# Altium schematic sheet PowerLegs.SchDoc: Title
size 594 x 420 mm; CompanyName: Лаборатория беспилотных систем; Address1: Address1; Address2: Address2; Address3: Address3; Address4: Address4; DocumentNumber: АБВГ.123456.001 Э3; SheetNumber: 2; SheetTotal: 2; Scale: -; DocumentType: Схема электрическая принципиальная; FirstReferrence: АБВГ.123456.001
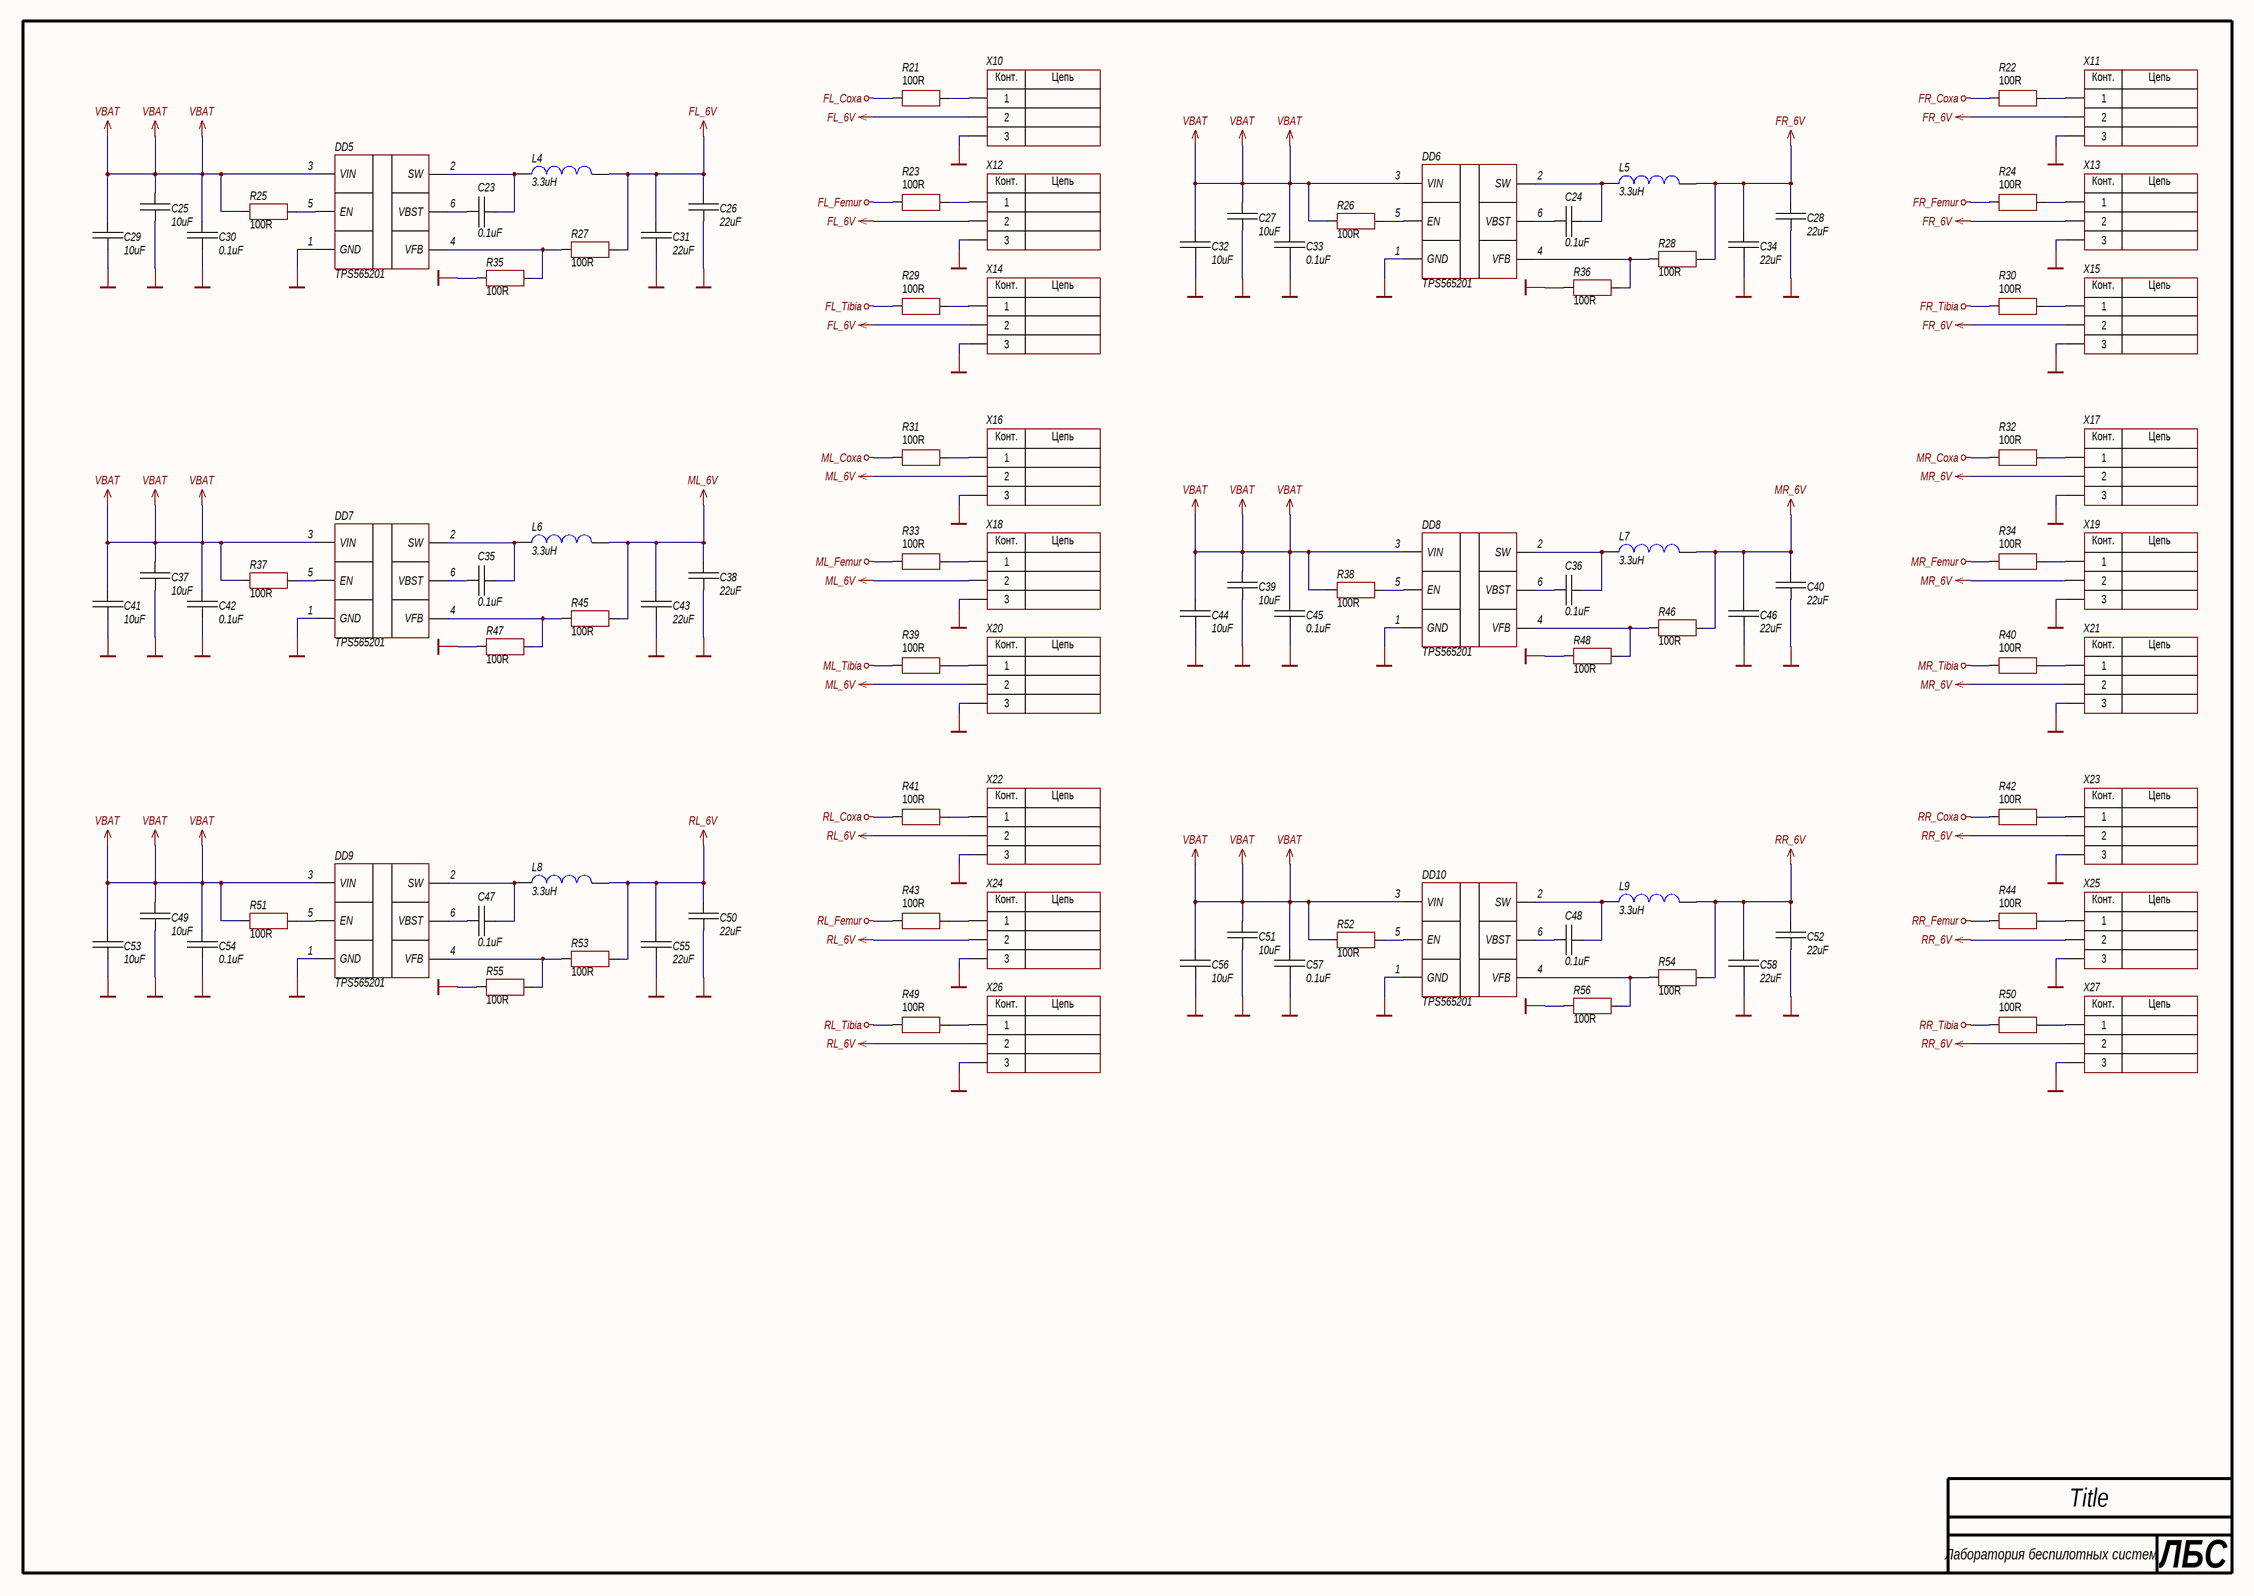
[diagram p0: PowerLegs.SchDoc]

## Parts
C23  value 0.1uF  [CAP: 0603]  (hidden comment: Ceramic capacitor, 0.01uF, X7R, ±10%, 16V, 0603, -55...+125°C)
C24  value 0.1uF  [CAP: 0603]  (hidden comment: Ceramic capacitor, 0.01uF, X7R, ±10%, 16V, 0603, -55...+125°C)
C25  value 10uF  [CAP: 1206]
C26  value 22uF  [CAP: 1206]  (hidden comment: Ceramic capacitor, 10uF, X7R, ±10%, 50V, 1206, -55...+125°C)
C27  value 10uF  [CAP: 1206]  (hidden comment: Ceramic capacitor, 0.1uF, X7R, ±10%, 16V, 0603, -55...+125°C)
C28  value 22uF  [CAP: 1206]  (hidden comment: Ceramic capacitor, 10uF, X7R, ±10%, 50V, 1206, -55...+125°C)
C29  value 10uF  [CAP: 1206]
C30  value 0.1uF  [CAP: 0603]
C31  value 22uF  [CAP: 1206]  (hidden comment: Polymer Cap, 330uF, 35V, ±20%, 40mOhm@100kHz, SMD,7.3x4.3х1.9mm, -55...+125°C)
C32  value 10uF  [CAP: 1206]  (hidden comment: Polymer Cap, 330uF, 35V, ±20%, 40mOhm@100kHz, SMD,7.3x4.3х1.9mm, -55...+125°C)
C33  value 0.1uF  [CAP: 0603]
C34  value 22uF  [CAP: 1206]  (hidden comment: Ceramic capacitor, 0.1uF, X7R, ±10%, 16V, 0603, -55...+125°C)
C35  value 0.1uF  [CAP: 0603]
C36  value 0.1uF  [CAP: 0603]
C37  value 10uF  [CAP: 1206]  (hidden comment: Ceramic capacitor, 0.01uF, X7R, ±10%, 16V, 0603, -55...+125°C)
C38  value 22uF  [CAP: 1206]  (hidden comment: Ceramic capacitor, 0.01uF, X7R, ±10%, 16V, 0603, -55...+125°C)
C39  value 10uF  [CAP: 1206]
C40  value 22uF  [CAP: 1206]  (hidden comment: Ceramic capacitor, 10uF, X7R, ±10%, 50V, 1206, -55...+125°C)
C41  value 10uF  [CAP: 1206]  (hidden comment: Ceramic capacitor, 0.1uF, X7R, ±10%, 16V, 0603, -55...+125°C)
C42  value 0.1uF  [CAP: 0603]  (hidden comment: Ceramic capacitor, 10uF, X7R, ±10%, 50V, 1206, -55...+125°C)
C43  value 22uF  [CAP: 1206]  (hidden comment: Ceramic capacitor, 10uF, X7R, ±10%, 50V, 1206, -55...+125°C)
C44  value 10uF  [CAP: 1206]  (hidden comment: Ceramic capacitor, 0.1uF, X7R, ±10%, 16V, 0603, -55...+125°C)
C45  value 0.1uF  [CAP: 0603]  (hidden comment: Polymer Cap, 330uF, 35V, ±20%, 40mOhm@100kHz, SMD,7.3x4.3х1.9mm, -55...+125°C)
C46  value 22uF  [CAP: 1206]  (hidden comment: Polymer Cap, 330uF, 35V, ±20%, 40mOhm@100kHz, SMD,7.3x4.3х1.9mm, -55...+125°C)
C47  value 0.1uF  [CAP: 0603]
C48  value 0.1uF  [CAP: 0603]
C49  value 10uF  [CAP: 1206]
C50  value 22uF  [CAP: 1206]
C51  value 10uF  [CAP: 1206]  (hidden comment: Ceramic capacitor, 0.01uF, X7R, ±10%, 16V, 0603, -55...+125°C)
C52  value 22uF  [CAP: 1206]  (hidden comment: Ceramic capacitor, 0.01uF, X7R, ±10%, 16V, 0603, -55...+125°C)
C53  value 10uF  [CAP: 1206]
C54  value 0.1uF  [CAP: 0603]  (hidden comment: Ceramic capacitor, 10uF, X7R, ±10%, 50V, 1206, -55...+125°C)
C55  value 22uF  [CAP: 1206]  (hidden comment: Ceramic capacitor, 0.1uF, X7R, ±10%, 16V, 0603, -55...+125°C)
C56  value 10uF  [CAP: 1206]
C57  value 0.1uF  [CAP: 0603]  (hidden comment: Ceramic capacitor, 10uF, X7R, ±10%, 50V, 1206, -55...+125°C)
C58  value 22uF  [CAP: 1206]  (hidden comment: Ceramic capacitor, 0.1uF, X7R, ±10%, 16V, 0603, -55...+125°C)
DD5  TPS565201  [SOT23-6]
DD6  TPS565201  [SOT23-6]
DD7  TPS565201  [SOT23-6]
DD8  TPS565201  [SOT23-6]
DD9  TPS565201  [SOT23-6]
DD10  TPS565201  [SOT23-6]
L4  value 3.3uH  [IND: SMD_L2.5-W2.0]  (hidden comment: Fixed inductor, 15uH, ±20%, SMD,2x2.5mm, 1.1A,)
L5  value 3.3uH  [IND: SMD_L2.5-W2.0]  (hidden comment: Fixed inductor, 15uH, ±20%, SMD,2x2.5mm, 1.1A,)
L6  value 3.3uH  [IND: SMD_L2.5-W2.0]  (hidden comment: Fixed inductor, 15uH, ±20%, SMD,2x2.5mm, 1.1A,)
L7  value 3.3uH  [IND: SMD_L2.5-W2.0]  (hidden comment: Fixed inductor, 15uH, ±20%, SMD,2x2.5mm, 1.1A,)
L8  value 3.3uH  [IND: SMD_L2.5-W2.0]  (hidden comment: Fixed inductor, 15uH, ±20%, SMD,2x2.5mm, 1.1A,)
L9  value 3.3uH  [IND: SMD_L2.5-W2.0]  (hidden comment: Fixed inductor, 15uH, ±20%, SMD,2x2.5mm, 1.1A,)
R21  value 100R  [RES: 0603]
R22  value 100R  [RES: 0603]
R23  value 100R  [RES: 0603]
R24  value 100R  [RES: 0603]
R25  value 100R  [RES: 0603]
R26  value 100R  [RES: 0603]
R27  value 100R  [RES: 0603]
R28  value 100R  [RES: 0603]
R29  value 100R  [RES: 0603]
R30  value 100R  [RES: 0603]
R31  value 100R  [RES: 0603]
R32  value 100R  [RES: 0603]
R33  value 100R  [RES: 0603]
R34  value 100R  [RES: 0603]
R35  value 100R  [RES: 0603]
R36  value 100R  [RES: 0603]
R37  value 100R  [RES: 0603]
R38  value 100R  [RES: 0603]
R39  value 100R  [RES: 0603]
R40  value 100R  [RES: 0603]
R41  value 100R  [RES: 0603]
R42  value 100R  [RES: 0603]
R43  value 100R  [RES: 0603]
R44  value 100R  [RES: 0603]
R45  value 100R  [RES: 0603]
R46  value 100R  [RES: 0603]
R47  value 100R  [RES: 0603]
R48  value 100R  [RES: 0603]
R49  value 100R  [RES: 0603]
R50  value 100R  [RES: 0603]
R51  value 100R  [RES: 0603]
R52  value 100R  [RES: 0603]
R53  value 100R  [RES: 0603]
R54  value 100R  [RES: 0603]
R55  value 100R  [RES: 0603]
R56  value 100R  [RES: 0603]
X10  (no value)  [CON: PLS-3]
X11  (no value)  [CON: PLS-3]
X12  (no value)  [CON: PLS-3]
X13  (no value)  [CON: PLS-3]
X14  (no value)  [CON: PLS-3]
X15  (no value)  [CON: PLS-3]
X16  (no value)  [CON: PLS-3]
X17  (no value)  [CON: PLS-3]
X18  (no value)  [CON: PLS-3]
X19  (no value)  [CON: PLS-3]
X20  (no value)  [CON: PLS-3]
X21  (no value)  [CON: PLS-3]
X22  (no value)  [CON: PLS-3]
X23  (no value)  [CON: PLS-3]
X24  (no value)  [CON: PLS-3]
X25  (no value)  [CON: PLS-3]
X26  (no value)  [CON: PLS-3]
X27  (no value)  [CON: PLS-3]

## Nets
FL_6V: C26.2 C31.1 L4.1 R27.1 X10.2 X12.2 X14.2
FL_Coxa: R21.1
FL_Femur: R23.1
FL_Tibia: R29.1
FR_6V: C28.2 C34.1 L5.1 R28.1 X11.2 X13.2 X15.2
FR_Coxa: R22.1
FR_Femur: R24.1
FR_Tibia: R30.1
GND: C25.1 C26.1 C27.1 C28.1 C29.1 C30.1 C31.2 C32.2 C33.2 C34.2 C37.1 C38.1 C39.1 C40.1 C41.1 C42.1 C43.1 C44.1 C45.2 C46.2 C49.1 C50.1 C51.1 C52.1 C53.1 C54.1 C55.1 C56.1 C57.1 C58.1 DD5.1(GND) DD6.1(GND) DD7.1(GND) DD8.1(GND) DD9.1(GND) DD10.1(GND) R35.2 R36.2 R47.2 R48.2 R55.2 R56.2 X10.3 X11.3 X12.3 X13.3 X14.3 X15.3 X16.3 X17.3 X18.3 X19.3 X20.3 X21.3 X22.3 X23.3 X24.3 X25.3 X26.3 X27.3
ML_6V: C38.2 C43.2 L6.1 R45.1 X16.2 X18.2 X20.2
ML_Coxa: R31.1
ML_Femur: R33.1
ML_Tibia: R39.1
MR_6V: C40.2 C46.1 L7.1 R46.1 X17.2 X19.2 X21.2
MR_Coxa: R32.1
MR_Femur: R34.1
MR_Tibia: R40.1
RL_6V: C50.2 C55.2 L8.1 R53.1 X22.2 X24.2 X26.2
RL_Coxa: R41.1
RL_Femur: R43.1
RL_Tibia: R49.1
RR_6V: C52.2 C58.2 L9.1 R54.1 X23.2 X25.2 X27.2
RR_Coxa: R42.1
RR_Femur: R44.1
RR_Tibia: R50.1
VBAT: C25.2 C27.2 C29.2 C30.2 C32.2 C33.2 C37.2 C39.2 C41.2 C42.2 C44.2 C45.2 C49.2 C51.2 C53.2 C54.2 C56.2 C57.2 DD5.3(VIN) DD6.3(VIN) DD7.3(VIN) DD8.3(VIN) DD9.3(VIN) DD10.3(VIN) R25.2 R26.2 R37.2 R38.2 R51.2 R52.2
NetC23_1: C23.1 DD5.2(SW) L4.2
NetC23_2: C23.2 DD5.6(VBST)
NetC24_1: C24.1 DD6.2(SW) L5.2
NetC24_2: C24.2 DD6.6(VBST)
NetC35_1: C35.1 DD7.2(SW) L6.2
NetC35_2: C35.2 DD7.6(VBST)
NetC36_1: C36.1 DD8.2(SW) L7.2
NetC36_2: C36.2 DD8.6(VBST)
NetC47_1: C47.1 DD9.2(SW) L8.2
NetC47_2: C47.2 DD9.6(VBST)
NetC48_1: C48.1 DD10.2(SW) L9.2
NetC48_2: C48.2 DD10.6(VBST)
NetDD5_4: DD5.4(VFB) R27.2 R35.1
NetDD5_5: DD5.5(EN) R25.1
NetDD6_4: DD6.4(VFB) R28.2 R36.1
NetDD6_5: DD6.5(EN) R26.1
NetDD7_4: DD7.4(VFB) R45.2 R47.1
NetDD7_5: DD7.5(EN) R37.1
NetDD8_4: DD8.4(VFB) R46.2 R48.1
NetDD8_5: DD8.5(EN) R38.1
NetDD9_4: DD9.4(VFB) R53.2 R55.1
NetDD9_5: DD9.5(EN) R51.1
NetDD10_4: DD10.4(VFB) R54.2 R56.1
NetDD10_5: DD10.5(EN) R52.1
NetR21_2: R21.2 X10.1
NetR22_2: R22.2 X11.1
NetR23_2: R23.2 X12.1
NetR24_2: R24.2 X13.1
NetR29_2: R29.2 X14.1
NetR30_2: R30.2 X15.1
NetR31_2: R31.2 X16.1
NetR32_2: R32.2 X17.1
NetR33_2: R33.2 X18.1
NetR34_2: R34.2 X19.1
NetR39_2: R39.2 X20.1
NetR40_2: R40.2 X21.1
NetR41_2: R41.2 X22.1
NetR42_2: R42.2 X23.1
NetR43_2: R43.2 X24.1
NetR44_2: R44.2 X25.1
NetR49_2: R49.2 X26.1
NetR50_2: R50.2 X27.1

## Notes on the sheet
- ЛБС
- (in symbol PLS-3) Конт.; Цепь

## Library data of the parts
C23 C24 = Ceramic_0603: Manufacturer: Yageo; PartNumber: CC0603KRX7R7BB104; ValueManufacturerPartNumber: Ceramic capacitor, 0.1uF, X7R, ±10%, 16V, 0603, -55...+125°C; Package: 0603; HelpURL: https://www.digikey.com/product-detail/en/yageo/CC0603KRX7R7BB104/311-1088-1-ND/302998; Temperature: -55...+125°C; TypeCapacitor: Ceramic capacitor; Tolerance: ±10%; TypeDielectric: X7R; Voltage: 16V
C25 C29 C32 C39 C49 C53 C56 = Ceramic_1206: Manufacturer: Yageo; PartNumber: CC1206KRX7R9BB104; ValueManufacturerPartNumber: Ceramic capacitor, 10uF, X7R, ±10%, 50V, 1206, -55...+125°C; TypeCapacitor: Ceramic capacitor; Tolerance: ±10%; TypeDielectric: X7R; Voltage: 50V; Package: 1206; HelpURL: https://www.digikey.com/product-detail/en/yageo/CC1206KRX7R9BB104/311-1179-1-ND/303089; Temperature: -55...+125°C
C26 C28 C40 C43 = Ceramic_1206: Manufacturer: Yageo; PartNumber: CC1206KRX7R9BB104; ValueManufacturerPartNumber: Ceramic capacitor, 22uF, X7R, ±10%, 50V, 1206, -55...+125°C; Package: 1206; HelpURL: https://www.digikey.com/product-detail/en/yageo/CC1206KRX7R9BB104/311-1179-1-ND/303089; Temperature: -55...+125°C; TypeCapacitor: Ceramic capacitor; Tolerance: ±10%; TypeDielectric: X7R; Voltage: 50V
C27 C37 C41 C44 C51 = Ceramic_1206: Manufacturer: Yageo; PartNumber: CC1206KRX7R9BB104; ValueManufacturerPartNumber: Ceramic capacitor, 10uF, X7R, ±10%, 50V, 1206, -55...+125°C; Voltage: 50V; Package: 1206; HelpURL: https://www.digikey.com/product-detail/en/yageo/CC1206KRX7R9BB104/311-1179-1-ND/303089; Temperature: -55...+125°C; TypeCapacitor: Ceramic capacitor; Tolerance: ±10%; TypeDielectric: X7R
C30 C33 C35 C36 C45 C47 C48 = Ceramic_0603: Manufacturer: Yageo; PartNumber: CC0603KRX7R7BB104; ValueManufacturerPartNumber: Ceramic capacitor, 0.1uF, X7R, ±10%, 16V, 0603, -55...+125°C; TypeCapacitor: Ceramic capacitor; Tolerance: ±10%; TypeDielectric: X7R; Voltage: 16V; Package: 0603; HelpURL: https://www.digikey.com/product-detail/en/yageo/CC0603KRX7R7BB104/311-1088-1-ND/302998; Temperature: -55...+125°C
C31 C46 C50 = Ceramic_1206: Manufacturer: Yageo; PartNumber: CC1206KRX7R9BB104; ValueManufacturerPartNumber: Ceramic capacitor, 22uF, X7R, ±10%, 50V, 1206, -55...+125°C; TypeCapacitor: Ceramic capacitor; Tolerance: ±10%; TypeDielectric: X7R; Voltage: 50V; Package: 1206; HelpURL: https://www.digikey.com/product-detail/en/yageo/CC1206KRX7R9BB104/311-1179-1-ND/303089; Temperature: -55...+125°C
C34 C38 C52 C55 C58 = Ceramic_1206: Manufacturer: Yageo; PartNumber: CC1206KRX7R9BB104; ValueManufacturerPartNumber: Ceramic capacitor, 22uF, X7R, ±10%, 50V, 1206, -55...+125°C; Voltage: 50V; Package: 1206; HelpURL: https://www.digikey.com/product-detail/en/yageo/CC1206KRX7R9BB104/311-1179-1-ND/303089; Temperature: -55...+125°C; TypeCapacitor: Ceramic capacitor; Tolerance: ±10%; TypeDielectric: X7R
C42 C54 C57 = Ceramic_0603: Manufacturer: Yageo; PartNumber: CC0603KRX7R7BB104; ValueManufacturerPartNumber: Ceramic capacitor, 0.1uF, X7R, ±10%, 16V, 0603, -55...+125°C; Voltage: 16V; Package: 0603; HelpURL: https://www.digikey.com/product-detail/en/yageo/CC0603KRX7R7BB104/311-1088-1-ND/302998; Temperature: -55...+125°C; TypeCapacitor: Ceramic capacitor; Tolerance: ±10%; TypeDielectric: X7R
L4-L9 = Inductor_FTC252010S220MBCA: Manufacturer: Sunlord; PartNumber: FTC252010S220MBCA; Package: SMD,2x2.5mm; HelpURL: https://jlcpcb.com/partdetail/6763511-FTC252010S220MBCA/C5832391; ValueManufacturerPartNumber: =TypeInductor+', '+Value+', '+Tolerance+', '+Package+', '+MaxCurrent+', '+Temperature; TypeInductor: Fixed inductor; MaxCurrent: 1.1A; SupplierCode: C5832391; Tolerance: ±20%
R21-R56 = Resistor_0603: Manufacturer: Yageo; PartNumber: RC0603JR-07100RL; ValueManufacturerPartNumber: Resistor film, 100R, ±5%, 0603, 0.1W, -55...+125°C; TypeResistor: Resistor film; Power: 0.1W; Tolerance: ±5%; Package: 0603; HelpURL: https://www.digikey.com/product-detail/en/yageo/RC0603JR-07100RL/311-100GRCT-ND/729644; Temperature: -55...+125°C
X10-X27 = PLS-3: Manufacturer: Connfly; ValueManufacturerPartNumber: Connector, 3pin, 2.54mm, 500VAC, 3A; TypeConnector: Connector; Voltage: 500VAC; Pitch: 2.54mm; Current: 3A; Multichannel: 3pin; HelpURL: https://www.chipdip.ru/product/pls-3; PartNumber: PLS-3